# EasyEDA Pro project 干簧管.eprj

# Schematic Schematic1
Board Name: Board1; Create Date: 2024-03-29; Page Name: P1; Project Name: 干簧管; Schematic Name: Schematic1; Update Date: 2025-04-06; Company: 嘉立创EDA; Page Size: A4; Version: V1.0
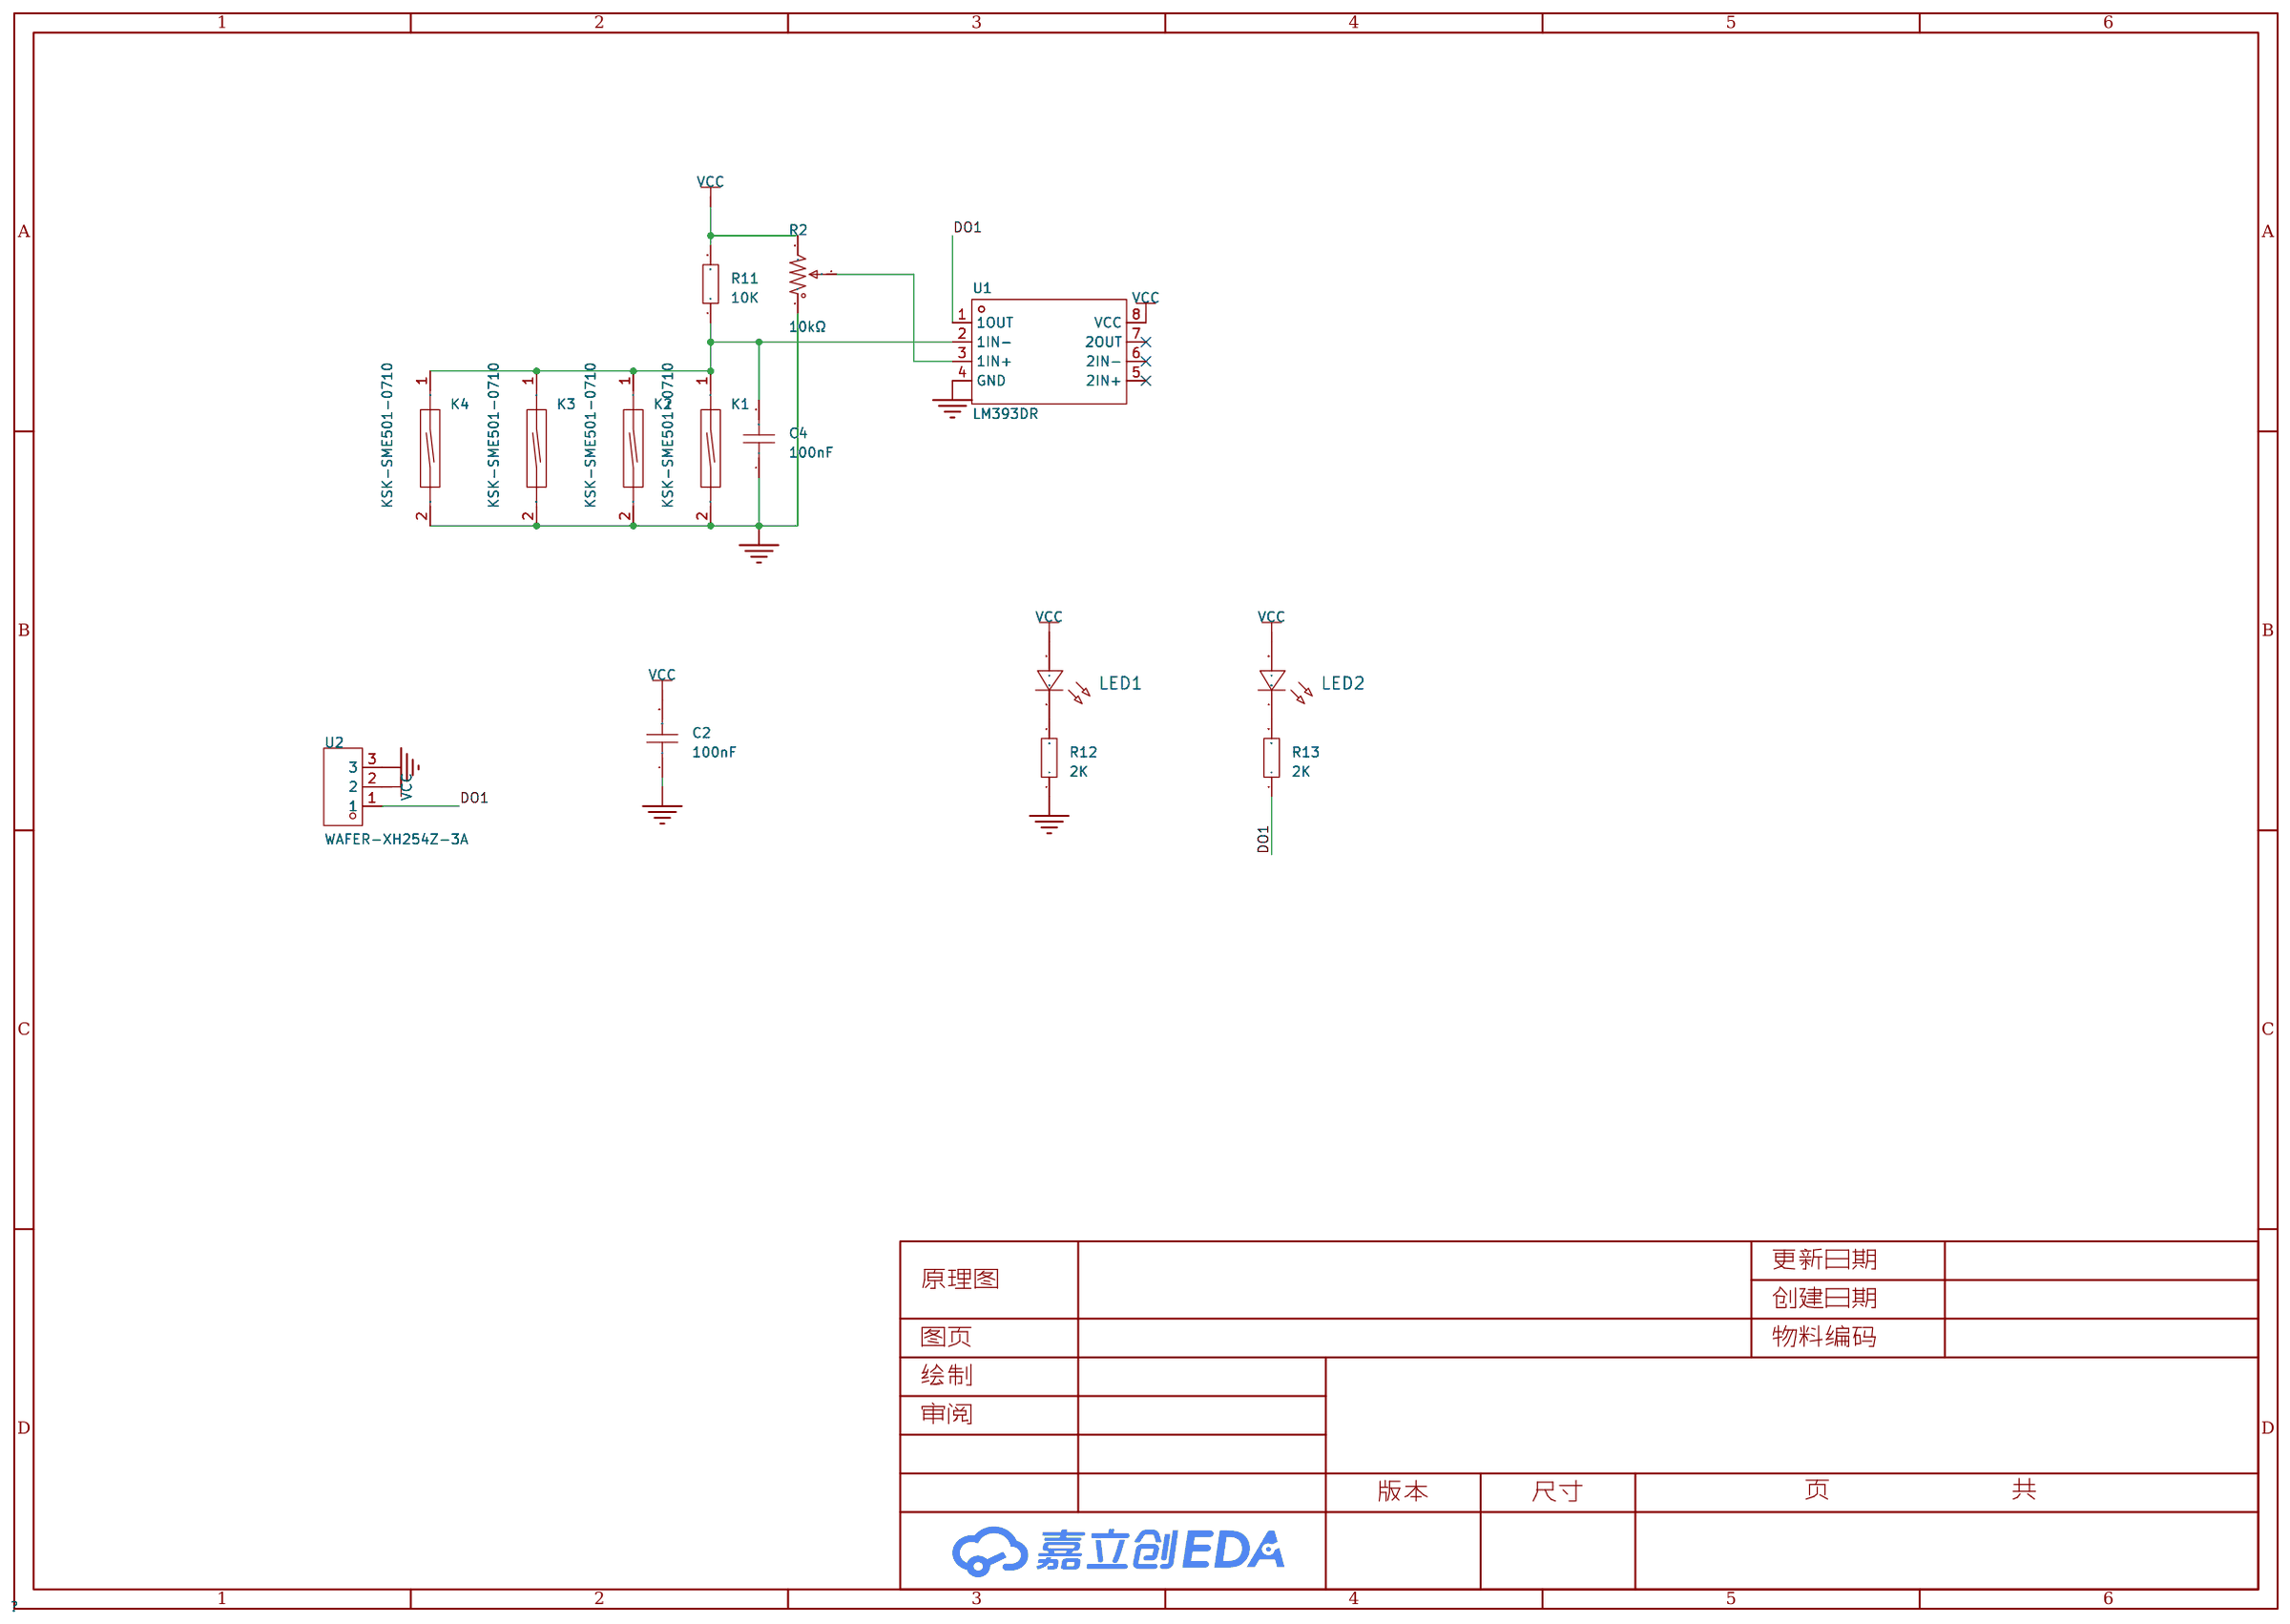
[diagram p0: schematic sheet]

## Parts
C2  100nF  [C0603]
C4  100nF  [C0603]
K1  KSK-SME501-0710  [DIP-TH_KSK-SME501-0710]
K2  KSK-SME501-0710  [DIP-TH_KSK-SME501-0710]
K3  KSK-SME501-0710  [DIP-TH_KSK-SME501-0710]
K4  KSK-SME501-0710  [DIP-TH_KSK-SME501-0710]
LED1  -  [LED_0603]
LED2  -  [LED_0603]
R2  10kΩ  [RES-ADJ-TH_3362P]
R11  10K  [R0603]
R12  2K  [R0603]
R13  2K  [R0603]
U1  LM393DR  [SOIC-8_L5.0-W4.0-P1.27-LS6.0-BL]
U2  WAFER-XH254Z-3A  [CONN-TH_XH-3A]

## Library data of the parts
C2 C4 = CAP_0603: Supplier Footprint: 0603
K1-K4 = KSK-SME501-0710: 长度12.7mm,7-10AT,10W/200VDC/0.5A,1常开; LCSC Part Name: 干簧管; Supplier Part: C575280; Manufacturer: STANDEXMEDER(斯丹麦德); Supplier Footprint: 插件; JLCPCB Part Class: 扩展库; Datasheet: https://atta.szlcsc.com/upload/public/pdf/source/20200615/C575280_BBFCF5EE2764EBA4C322B0317AC15A67.pdf; Supplier: LCSC
LED1 LED2 = LED_0603-R: Supplier Footprint: 0603
R2 = 3362P-1-103: 阻值:10kΩ;精度:±10%;; LCSC Part Name: 10kΩ ±10%; Supplier Part: C118956; Manufacturer: BOCHEN(博晨); Supplier Footprint: 插件; JLCPCB Part Class: 扩展库; Datasheet: https://atta.szlcsc.com/upload/public/pdf/source/20171114/C118956_15106326650691117445.pdf; Supplier: LCSC; Tolerance: ±10%
R11-R13 = Res_0603: Supplier Footprint: 0603
U1 = LM393DR: 输入失调电压(Vos):5mV;输入偏置电流(Ib):250nA;; Supplier Part: C67470; Manufacturer: TI(德州仪器); Supplier Footprint: SOIC-8; JLCPCB Part Class: 扩展库; Datasheet: https://www.ti.com/cn/lit/gpn/lm393; Supplier: LCSC; Input Offset Voltage (Vos): 5mV; Input Bias Current (Ib): 250nA; Supply Voltage: 1V~18V；2V~36V; Output Type: 开集; Supply Current: 2.5mA; Operating Temperature: 0℃~+70℃
U2 = WAFER-XH254Z-3A: Supplier Part: C7432683; Manufacturer: HANBO(汉博); Supplier Footprint: 插件,P=2.5mm; JLCPCB Part Class: 扩展库; Datasheet: https://atta.szlcsc.com/upload/public/pdf/source/20230718/3B4FABA5D38EFB02DAF74E7C2B33D98F.pdf; Supplier: LCSC; Pins Structure: 1x3P; Pitch: 2.54mm; Mounting Style: 直插; Reference Series: XH; Number of Pins: 3P; Number of Rows: 1; Number of PINs Per Row: 3; Current Rating (Max): 3A; Operating Temperature Range: -25℃~+85℃

## Nets
GND: C2.1 C4.1 K1.2 K2.2 K3.2 K4.2 R2.1 R12.1 U1.4(GND) U2.3
VCC: C2.2 LED1.2(A) LED2.2(A) R2.3 R11.2 U1.8(VCC) U2.2
DO1: R13.1 U1.1(1OUT) U2.1
$1N609: R2.2 U1.3(1IN+)
$1N3625: C4.2 K1.1 K2.1 K3.1 K4.1 R11.1 U1.2(1IN-)
$1N4237: LED1.1(C) R12.2
$1N4267: LED2.1(C) R13.2

Not connected (* = marked no-connect by the designer): U1 5(2IN+)* 6(2IN-)* 7(2OUT)*

# Board PCB1
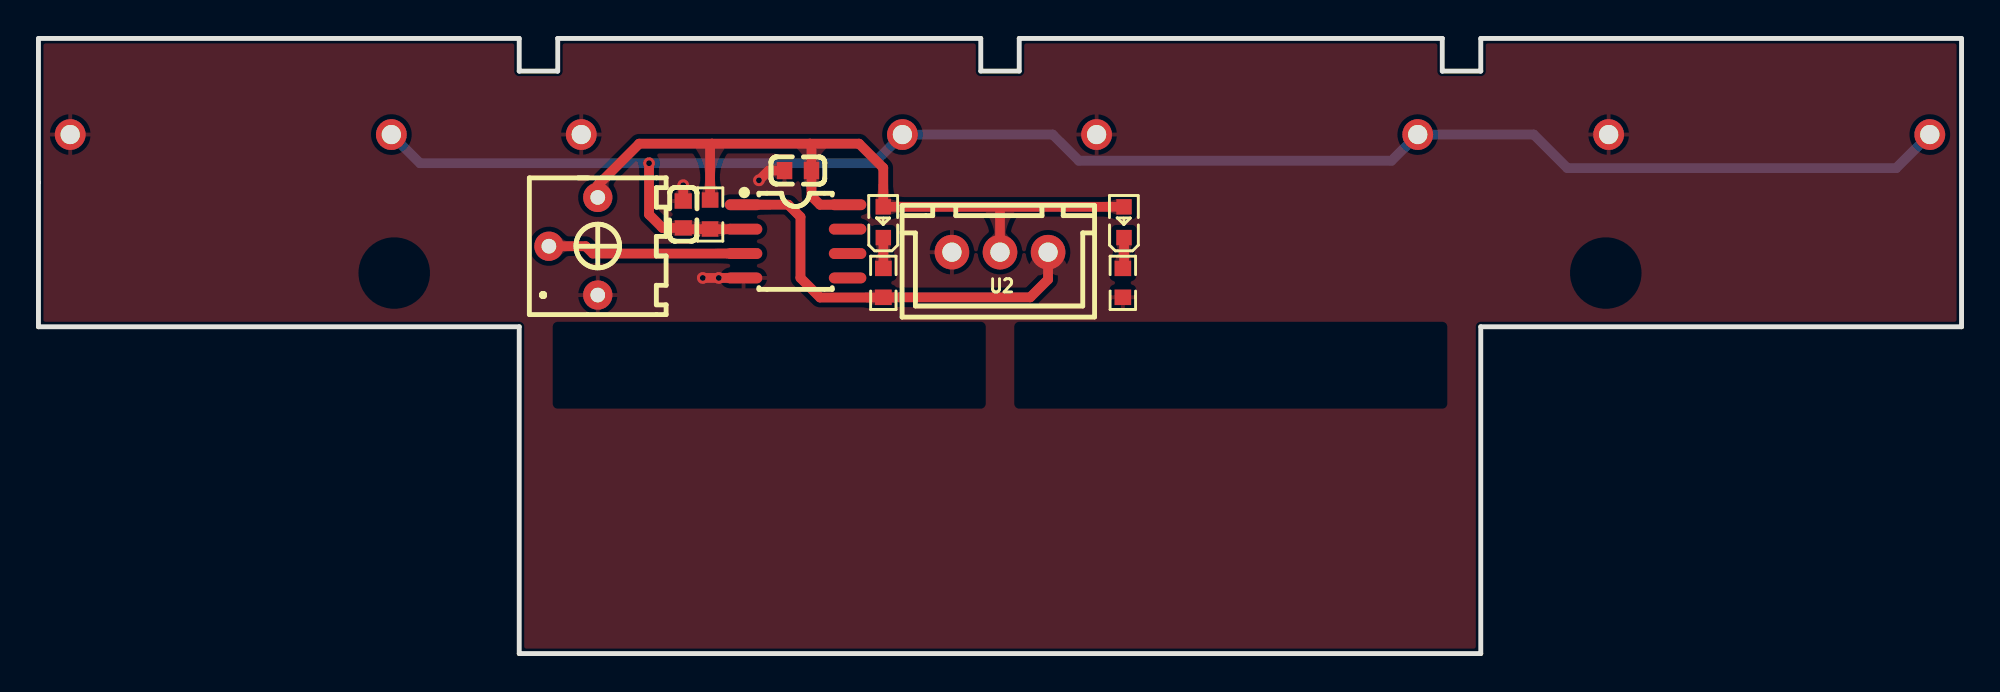
[diagram p1: board, top side]
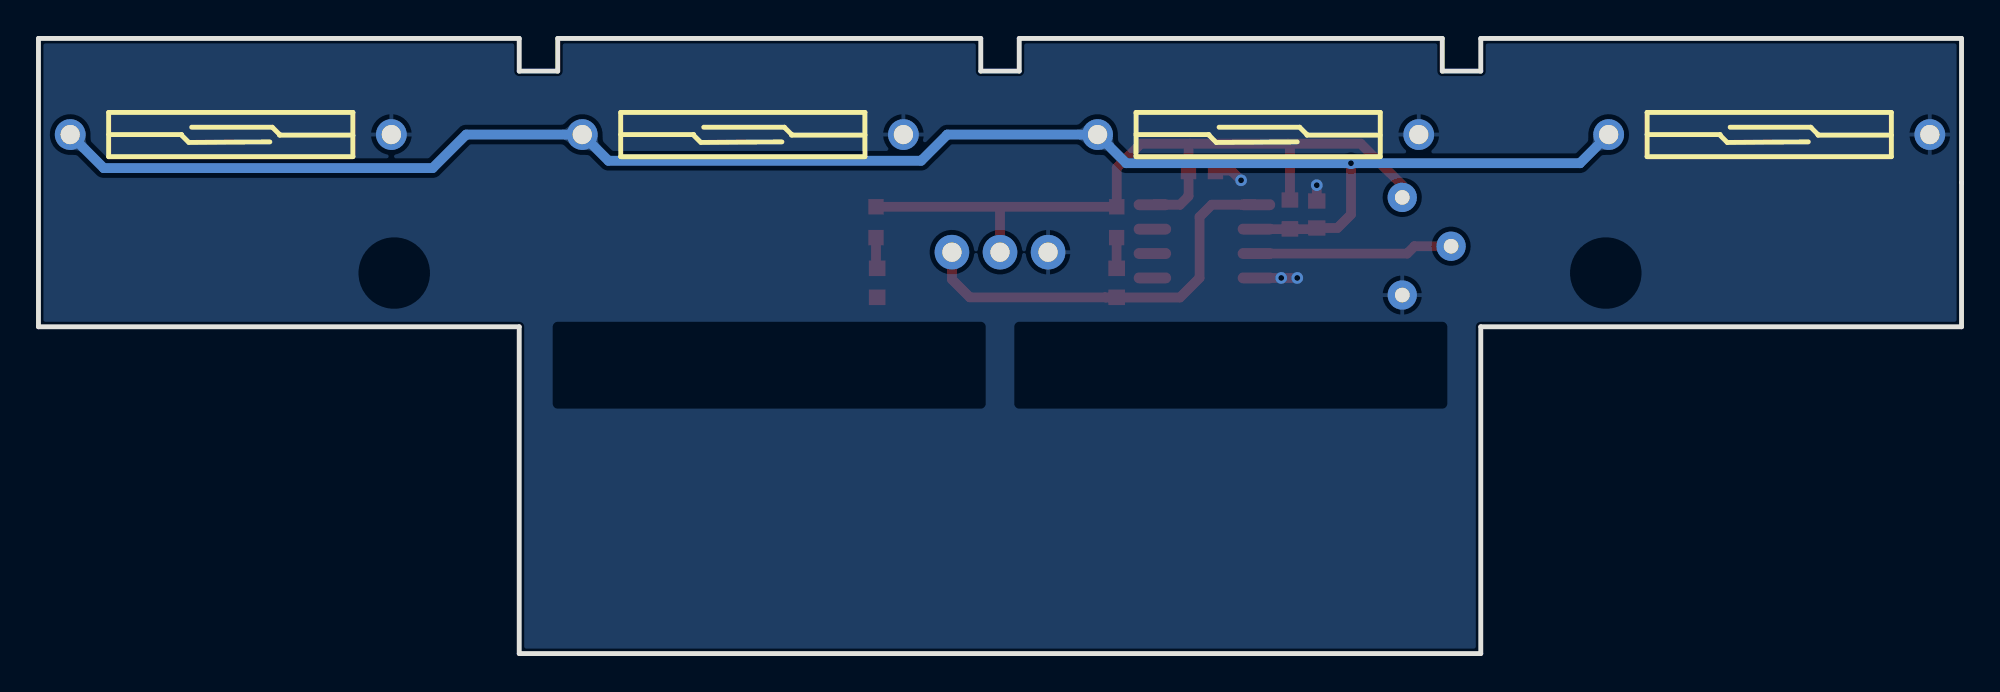
[diagram p2: board, bottom side, seen from below]

Outline 100 x 32 mm; copper layers: Top Layer, Bottom Layer. Coordinates in mm from the lower left corner of the outline.
Outline path: 0,32 0,17 25,17 25,0 75,0 75,17 100,17 100,32 75,32 75,30.3 73,30.3 73,32 51,32 51,30.3 49,30.3 49,32 27,32 27,30.3 25,30.3 25,32 0,32
Stack: Top Layer 0.035mm / Dielectric1 1.51mm FR4 er 4.5 / Bottom Layer 0.035mm

## Design rules (mm)
template: 自定义配置
spacing copperThickness1oz (default): track to track 0.102, other pairs 0.152 to 0.3
spacing copperThickness2oz: track to track 0.203, other pairs 0.152 to 0.3
track width copperThickness1oz (default): min 0.127, default 0.254, max 2.54
track width copperThickness2oz: min 0.203, default 0.254, max 2.54
differential pair differentialPair (default): width min 0.127, default 0.254, max 2.54; gap min 0.152, default 0.152
via viaSize (default): diameter min 0.5, default 0.61, max 10; hole min 0.3, default 0.305, max 6.299

## Placement (name value [footprint] x y rotation side)
C2  100nF  [C0603]  39.5 25.13 0 top
C4  100nF  [C0603]  33.53 22.84 270 top
K1  KSK-SME501-0710  [DIP-TH_KSK-SME501-0710]  90 27 180 bottom
K2  KSK-SME501-0710  [DIP-TH_KSK-SME501-0710]  63.37 27 180 bottom
K3  KSK-SME501-0710  [DIP-TH_KSK-SME501-0710]  36.58 27 180 bottom
K4  KSK-SME501-0710  [DIP-TH_KSK-SME501-0710]  10 27 180 bottom
LED1  -  [LED_0603]  56.44 22.49 90 top
LED2  -  [LED_0603]  43.92 22.49 90 top
R2  10kΩ  [RES-ADJ-TH_3362P]  27.81 21.19 90 top
R11  10K  [R0603]  34.93 22.84 90 top
R12  2K  [R0603]  56.39 19.29 90 top
R13  2K  [R0603]  43.93 19.29 90 top
U1  LM393DR  [SOIC-8_L5.0-W4.0-P1.27-LS6.0-BL]  39.37 21.44 270 top
U2  WAFER-XH254Z-3A  [CONN-TH_XH-3A]  50 20.88 180 top

## Footprints (pads in the part's own frame, mm; a bottom-side part is the same pattern mirrored in y, then rotated)
C0603
  rect 0.8x0.9 smd: 1(-0.7,0) 2(0.7,0)
CONN-TH_XH-3A
  round 1.8 hole 1: 1(-2.5,0) 2(0,0) 3(2.5,0)
DIP-TH_KSK-SME501-0710
  round 1.6 hole 1: 1(-8.35,0) 2(8.35,0)
LED_0603
  rect 0.8x0.8 smd: 1(-0.851,-0.01) 2(0.75,-0.005)
R0603
  rect 0.806x0.864 smd: 1(-0.753,0) 2(0.753,0)
RES-ADJ-TH_3362P
  round 1.524 hole 0.762: 1(-2.54,-1.27) 2(0,1.27) 3(2.54,-1.27)
SOIC-8_L5.0-W4.0-P1.27-LS6.0-BL
  oval 0.569x1.95 smd: 1(-1.905,-2.705) 2(-0.635,-2.705) 3(0.635,-2.705) 4(1.905,-2.705) 5(1.905,2.705) 6(0.635,2.705) 7(-0.635,2.705) 8(-1.905,2.705)

## Nets
As in the schematic.

Pads without a net: U1 5 6 7

## Via types
v1: diameter 0.61, hole 0.305, Top Layer to Bottom Layer, 5 vias

## Routing (per net, layer and track width the routed paths; a pad name or vN(x,y) marks a point on that pad's centre or on a via; arc(x,y) is an arc through that point)
GND: length 4.5
  Top Layer w0.508: v1(34.54,19.54) v1(35.38,19.54) U1.4 ; 38.8,25.13 37.97,25.13 v1(37.47,24.62) ; C4.1 v1(33.53,24.37)
VCC: length 41.6
  Top Layer w0.508: 35.02,26.53 34.93,26.43 R11.2 ; 35.02,26.53 40.11,26.53 ; 35.02,26.53 31.24,26.53 29.08,24.37 R2.3 ; 49.94,23.24 50,23.18 U2.2 ; 49.94,23.24 43.93,23.24 43.93,25.27 42.67,26.53 40.11,26.53 ; 49.94,23.24 LED1.2 ; 40.11,26.53 40.2,26.44 C2.2 40.2,23.79 40.64,23.35 U1.8
DO1: length 21.5
  Top Layer w0.508: U1.1 38.99,23.35 39.62,22.72 39.62,19.54 40.64,18.52 44.51,18.52 44.52,18.53 51.57,18.53 52.5,19.46 U2.1
$1N609: length 10.3
  Top Layer w0.508: U1.3 28.83,20.81 28.45,21.19 R2.2
$1N3625: length 91.7
  Top Layer w0.508: v1(31.75,25.51) 31.75,22.84 32.45,22.14 C4.2 33.59,22.08 U1.2
  Bottom Layer w0.508: K1.1 96.6,25.25 79.5,25.25 77.76,27 71.72,27 70.36,25.64 54.1,25.64 52.74,27 K3.1 43.44,25.51 v1(31.75,25.51) 19.84,25.51 K4.1
$1N4237: length 1.6
  Top Layer w0.508: LED1.1 56.45,20.1 R12.2
$1N4267: length 1.6
  Top Layer w0.508: LED2.1 R13.2

## Copper pours and planes (outline as drawn; the poured copper is in the pictures)
GND on Top Layer: -2.16,35.16 102.49,35.16 102.49,-1.54 -2.16,-1.54
GND on Bottom Layer: -3.17,35.67 104.14,35.67 104.14,-2.3 -3.17,-2.3

Small or netless copper shapes (teardrops, artwork), in the pictures only: 36 on Top Layer, 8 on Bottom Layer
